# Altium project Ezlo_Voice_AssistantHUB.PrjPcb (part 8 of 10)

## Sheet USB_Sheet.SchDoc
size A4; DocumentNumber: 19; SheetNumber: 19; SheetTotal: 27
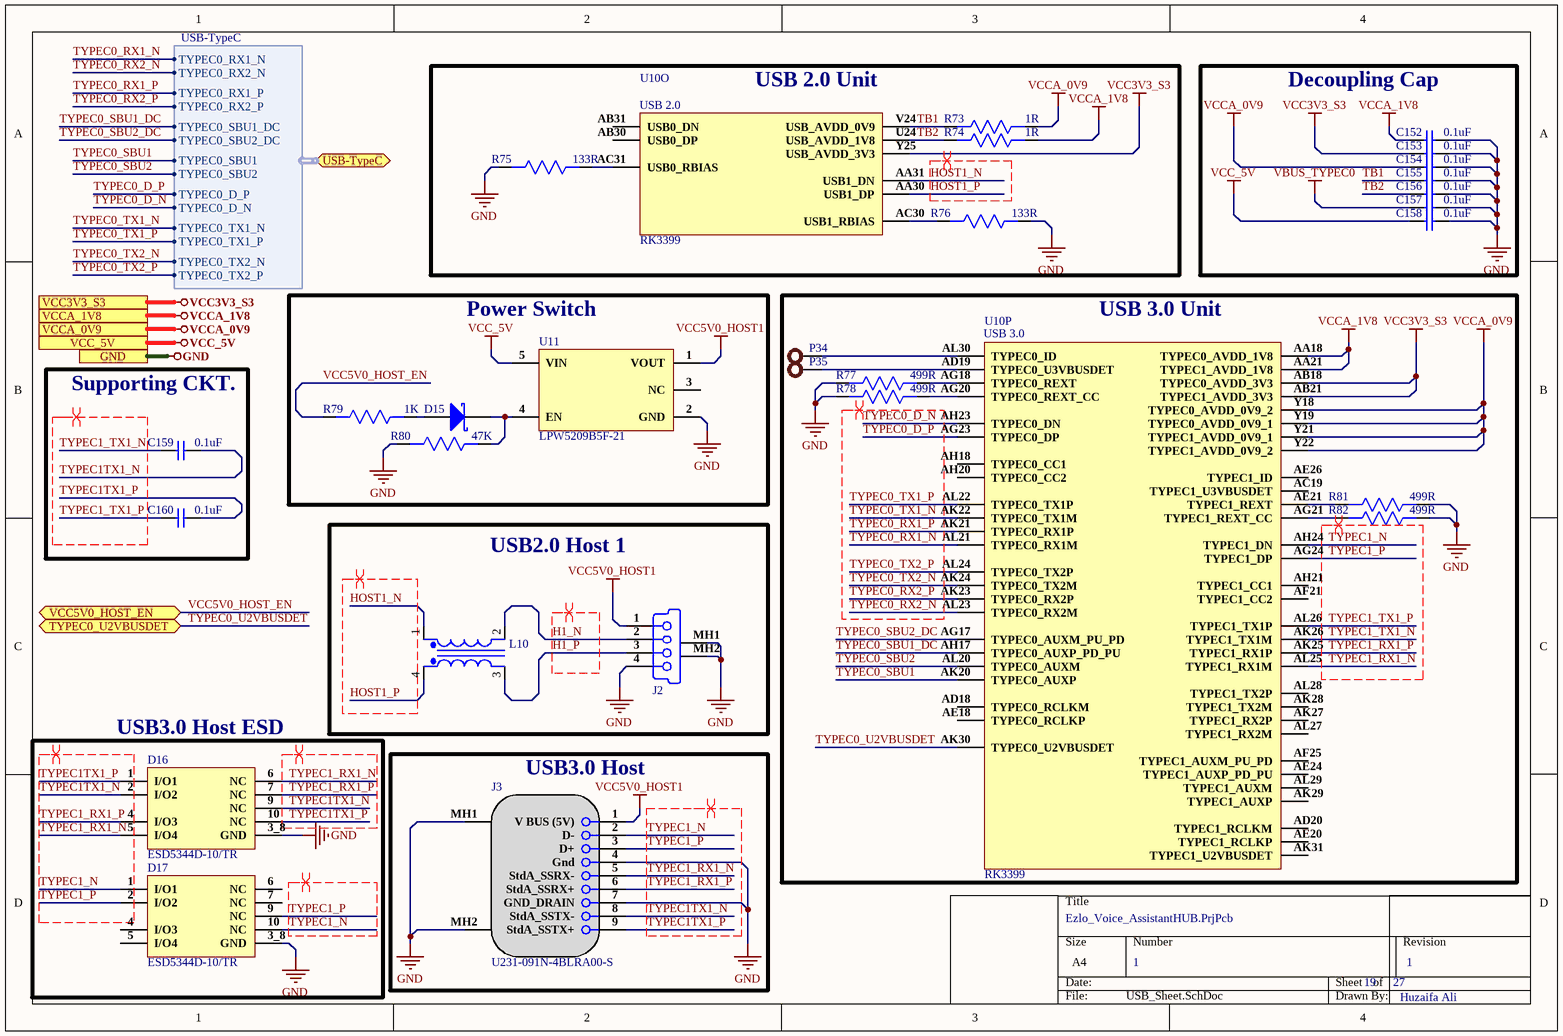
[diagram p17: USB_Sheet.SchDoc]

### Parts
C152  0.1uF  [Cap0402]
C153  0.1uF  [Cap0402]
C154  0.1uF  [Cap0402]
C155  0.1uF  [Cap0402]
C156  0.1uF  [Cap0402]
C157  0.1uF  [Cap0402]
C158  0.1uF  [Cap0402]
C159  0.1uF  [Cap0402]
C160  0.1uF  [Cap0402]
D15  B5819WS  [SOD-323]  (value not drawn)
D16  ESD5344D-10/TR  [DFN2510-10L]
D17  ESD5344D-10/TR  [DFN2510-10L]
J2  61400416021  [61400416021]  (value not drawn)
J3  U231-091N-4BLRA00-S  [U231-091N-4BLRA00-S]
L10  SDCW2012-2-900TF  [SDCW2012-2-900TF]  (value not drawn)
P34  TEST POINT  [TEST POINT]  (value not drawn)
P35  TEST POINT  [TEST POINT]  (value not drawn)
R73  1R  [Res0603]
R74  1R  [Res0603]
R75  133R  [Res0603]
R76  133R  [Res0603]
R77  499R  [Res0603]
R78  499R  [Res0603]
R79  1K  [Res0603]
R80  47K  [Res0603]
R81  499R  [Res0603]
R82  499R  [Res0603]
U10  RK3399  [RK3399]  (parts O,P of 34)
U11  LPW5209B5F-21  [SOT-23-5]

### Blocks framed on the sheet
USB 2.0 Unit: R73-R76 U10
Decoupling Cap: C152-C158
Power Switch: D15 R79 R80 U11
USB 3.0 Unit: P34 P35 R77 R78 R81 R82 U10
Supporting CKT.: C159 C160
USB2.0 Host 1: J2 L10
USB3.0 Host ESD: D16 D17
USB3.0 Host: J3

### Ports
GND, TYPEC0_U2VBUSDET (bidir), USB-TypeC (bidir, harness USB-TypeC), VCC3V3_S3, VCC5V0_HOST_EN (bidir), VCC_5V, VCCA_0V9, VCCA_1V8

### Harnesses
USB-TypeC: TYPEC0_RX1_N, TYPEC0_RX2_N, TYPEC0_RX1_P, TYPEC0_RX2_P, TYPEC0_D_P, TYPEC0_D_N, TYPEC0_TX1_N, TYPEC0_TX1_P, TYPEC0_TX2_N, TYPEC0_TX2_P, TYPEC0_SBU1, TYPEC0_SBU2, TYPEC0_SBU1_DC, TYPEC0_SBU2_DC

### Nets
GND: C152.2 C153.2 C154.2 C155.2 C156.2 C157.2 C158.2 D16.3_8(GND) D17.3_8(GND) J2.4(NC) J2.MH1 J2.MH2 J3.4(Gnd) J3.7(GND_DRAIN) J3.MH1(Tab) J3.MH2(Tab) R75.2 R76.1 R77.2 R78.2 R80.2 R81.1 R82.1 U11.2(GND) ; port GND
VBUS_TYPEC0: C157.1
VCC3V3_S3: C153.1 U10.AB18(TYPEC0_AVDD_3V3) U10.AB21(TYPEC1_AVDD_3V3) U10.Y25(USB_AVDD_3V3) ; port VCC3V3_S3
VCC5V0_HOST1: J2.1(V_BUS_(5V)) J3.1(V_BUS_(5V)) U11.1(VOUT)
VCC_5V: C158.1 U11.5(VIN) ; port VCC_5V
VCCA_0V9: C154.1 R73.1 U10.Y18(TYPEC0_AVDD_0V9_2) U10.Y19(TYPEC0_AVDD_0V9_1) U10.Y21(TYPEC1_AVDD_0V9_1) U10.Y22(TYPEC1_AVDD_0V9_2) ; port VCCA_0V9
VCCA_1V8: C152.1 R74.1 U10.AA18(TYPEC0_AVDD_1V8) U10.AA21(TYPEC1_AVDD_1V8) ; port VCCA_1V8
H1_N: J2.2(D-) L10.2
H1_P: J2.3(D+) L10.3
HOST1_N: L10.1 U10.AA31(USB1_DN)
HOST1_P: L10.4 U10.AA30(USB1_DP)
TB1: C155.1 R73.2 U10.V24(USB_AVDD_0V9)
TB2: C156.1 R74.2 U10.U24(USB_AVDD_1V8)
TYPEC0_D_N: U10.AH23(TYPEC0_DN) ; port USB-TypeC.TYPEC0_D_N
TYPEC0_D_P: U10.AG23(TYPEC0_DP) ; port USB-TypeC.TYPEC0_D_P
TYPEC0_RX1_N: U10.AL21(TYPEC0_RX1M) ; port USB-TypeC.TYPEC0_RX1_N
TYPEC0_RX1_P: U10.AK21(TYPEC0_RX1P) ; port USB-TypeC.TYPEC0_RX1_P
TYPEC0_RX2_N: U10.AL23(TYPEC0_RX2M) ; port USB-TypeC.TYPEC0_RX2_N
TYPEC0_RX2_P: U10.AK23(TYPEC0_RX2P) ; port USB-TypeC.TYPEC0_RX2_P
TYPEC0_SBU1: U10.AK20(TYPEC0_AUXP) ; port USB-TypeC.TYPEC0_SBU1
TYPEC0_SBU1_DC: U10.AH17(TYPEC0_AUXP_PD_PU) ; port USB-TypeC.TYPEC0_SBU1_DC
TYPEC0_SBU2: U10.AL20(TYPEC0_AUXM) ; port USB-TypeC.TYPEC0_SBU2
TYPEC0_SBU2_DC: U10.AG17(TYPEC0_AUXM_PU_PD) ; port USB-TypeC.TYPEC0_SBU2_DC
TYPEC0_TX1_N: U10.AK22(TYPEC0_TX1M) ; port USB-TypeC.TYPEC0_TX1_N
TYPEC0_TX1_P: U10.AL22(TYPEC0_TX1P) ; port USB-TypeC.TYPEC0_TX1_P
TYPEC0_TX2_N: U10.AK24(TYPEC0_TX2M) ; port USB-TypeC.TYPEC0_TX2_N
TYPEC0_TX2_P: U10.AL24(TYPEC0_TX2P) ; port USB-TypeC.TYPEC0_TX2_P
TYPEC0_U2VBUSDET: U10.AK30(TYPEC0_U2VBUSDET) ; port TYPEC0_U2VBUSDET
TYPEC1_N: D17.1(I/O1) D17.10(NC) J3.2(D-) U10.AH24(TYPEC1_DN)
TYPEC1_P: D17.2(I/O2) D17.9(NC) J3.3(D+) U10.AG24(TYPEC1_DP)
TYPEC1_RX1_N: D16.5(I/O4) D16.6(NC) J3.5(StdA_SSRX-) U10.AL25(TYPEC1_RX1M)
TYPEC1_RX1_P: D16.4(I/O3) D16.7(NC) J3.6(StdA_SSRX+) U10.AK25(TYPEC1_RX1P)
TYPEC1_TX1_N: C159.1 U10.AK26(TYPEC1_TX1M)
TYPEC1_TX1_P: C160.1 U10.AL26(TYPEC1_TX1P)
TYPEC1TX1_N: C159.2 D16.2(I/O2) D16.9(NC) J3.8(StdA_SSTX-)
TYPEC1TX1_P: C160.2 D16.1(I/O1) D16.10(NC) J3.9(StdA_SSTX+)
VCC5V0_HOST_EN: R79.2 ; port VCC5V0_HOST_EN
NetD15_1: D15.1(K) R80.1 U11.4(EN)
NetD15_2: D15.2(A) R79.1
NetP34_1: P34.1 U10.AL30(TYPEC0_ID)
NetP35_1: P35.1 U10.AD19(TYPEC0_U3VBUSDET)
NetR75_1: R75.1 U10.AC31(USB0_RBIAS)
NetR76_2: R76.2 U10.AC30(USB1_RBIAS)
NetR77_1: R77.1 U10.AG18(TYPEC0_REXT)
NetR78_1: R78.1 U10.AG20(TYPEC0_REXT_CC)
NetR81_2: R81.2 U10.AE21(TYPEC1_REXT)
NetR82_2: R82.2 U10.AG21(TYPEC1_REXT_CC)

Not connected (* = marked no-connect by the designer): D17 4(I/O3) 5(I/O4) 6(NC) 7(NC); U10 AB30(USB0_DP) AB31(USB0_DN) AC19(TYPEC1_U3VBUSDET) AD18(TYPEC0_RCLKM) AD20(TYPEC1_RCLKM) AE18(TYPEC0_RCLKP) AE20(TYPEC1_RCLKP) AE24(TYPEC1_AUXP_PD_PU) AE26(TYPEC1_ID) AF21(TYPEC1_CC2) AF25(TYPEC1_AUXM_PU_PD) AH18(TYPEC0_CC1) AH20(TYPEC0_CC2) AH21(TYPEC1_CC1) AK27(TYPEC1_RX2P) AK28(TYPEC1_TX2M) AK29(TYPEC1_AUXP) AK31(TYPEC1_U2VBUSDET) AL27(TYPEC1_RX2M) AL28(TYPEC1_TX2P) AL29(TYPEC1_AUXM); U11 3(NC)

### Layout directives
differential pair; differential pair class TYPEC1_IO_Lines; net class TYPEC1; rule Impedance Constraint [Min = 85.00    Max = 90.00    ]; rule Matched Net Lengths [Tolerance = 50mil]: TYPEC1_N, TYPEC1_P, TYPEC1_RX1_N, TYPEC1_RX1_P, TYPEC1_TX1_N, TYPEC1_TX1_P, TYPEC1TX1_N, TYPEC1TX1_P
differential pair; differential pair class HOST1_IO_Lines; net class HOST1; rule Matched Net Lengths [Tolerance = 50mil]; rule Impedance Constraint [Min = 85.00    Max = 90.00    ]: HOST1_N, HOST1_P
differential pair; differential pair class H1_Lines; net class H1; rule Impedance Constraint [Min = 85.00    Max = 90.00    ]; rule Matched Net Lengths [Tolerance = 50mil]: H1_N, H1_P
differential pair; differential pair class TYPEC0_IO_Lines; net class TYPEC0; rule Impedance Constraint [Min = 85.00    Max = 90.00    ]; rule Matched Net Lengths [Tolerance = 50mil]: TYPEC0_D_N, TYPEC0_D_P, TYPEC0_RX1_N, TYPEC0_RX1_P, TYPEC0_RX2_N, TYPEC0_RX2_P, TYPEC0_TX1_N, TYPEC0_TX1_P, TYPEC0_TX2_N, TYPEC0_TX2_P

### Notes on the sheet
- 1
- Huzaifa Ali
- (in symbol RK3399, part O) USB 2.0
- (in symbol RK3399, part P) USB 3.0

### Library data of the parts
C152-C160 = CC0402KRX5R6BB104: CAP CER 0.1UF 10V X5R 0402; Manufacturer: Yageo; Capacitance: 100nF; Tolerance: 10%; Dissipation Factor: 5%; Insulation Resistance: 10GR; Supplier 1: Digi-Key; Manufacturer Part Number: CC0402KRX5R6BB104; RoHS: Yes; Category: Ceramic Capacitors; Stock 1: 6385580; Pricing 1: 1=0.10000, 10=0.02700, 50=0.01500, 100=0.01220, 500=0.00874, 1000=0.00687, 2500=0.00625, 5000=0.00575 (USD); Mount: Surface Mount; Case/Package: 0402; Number of Pins: 2; Case Code (Imperial): 0402; Case Code (Metric): 1005; Min Operating Temperature: -55°C; Max Operating Temperature: 85°C; Dielectric: X5R; Packaging: Tape and Reel; Voltage Rating: 10V; Package Quantity: 1; Termination: SMD/SMT; Voltage Rating (DC): 10V; Series: CC; Length: 1mm; Width: 0.02inch; Height: 0.5mm; Depth: 0.5mm; Thickness: 0.022inch; Radiation Hardening: No; RoHS Compliant: Yes; REACH SVHC: No SVHC; Lead Free: Lead Free; Halogen Free: Halogen Free; ComponentLink1URL: https://datasheet.ciiva.com/144/mlccorderingcode-144029.pdf?src-supplier=Digi-Key; ComponentLink1Description: https://datasheet.ciiva.com/144/mlccorderingcode-144029.pdf?src-supplier=Digi-Key; ComponentLink2URL: https://datasheet.ciiva.com/144/mlccorderingcode-144028.pdf?src-supplier=Digi-Key; ComponentLink2Description: https://datasheet.ciiva.com/144/mlccorderingcode-144028.pdf?src-supplier=Digi-Key; ComponentLink3URL: https://datasheet.ciiva.com/144/mlccorderingcode-144030.pdf?src-supplier=Digi-Key; ComponentLink3Description: https://datasheet.ciiva.com/144/mlccorderingcode-144030.pdf?src-supplier=Digi-Key; ComponentLink4URL: https://datasheet.ciiva.com/7978/1359354-7978091.pdf?src-supplier=Element14; ComponentLink4Description: https://datasheet.ciiva.com/7978/1359354-7978091.pdf?src-supplier=Element14; ComponentLink5URL: https://datasheet.ciiva.com/11587/upy-gphc-x5r-4v-to-50v-12-11587302.pdf?src-supplier=Avnet; ComponentLink5Description: https://datasheet.ciiva.com/11587/upy-gphc-x5r-4v-to-50v-12-11587302.pdf?src-supplier=Avnet; Supplier Part Number 1: 311-1336-1-ND
D15 = B5819WS: DIODE SCHOTTKY 40V 1A SOD323; Manufacturer: MDD; Manufacturer Part Number: B5819WS-TP; Max Surge Current: 10A; Forward Voltage: 900mV; Max Reverse Leakage Current: 1mA; Element Configuration: Single; Supplier 1: Arrow Electronics; RoHS: Yes; Category: Rectifier Diodes; Stock 1: 1701; Pricing 1: 1=0.34370, 10=0.18990, 25=0.18810, 100=0.11820, 250=0.11700, 500=0.08890, 1000=0.07420 (USD); Mount: Surface Mount; Number of Pins: 2; Min Operating Temperature: -65°C; Max Operating Temperature: 125°C; Package Quantity: 1; Packaging: Tape and Reel; Average Rectified Current: 1A; Peak Non-Repetitive Surge Current: 10A; Max Reverse Voltage (DC): 40V; Series: -; Radiation Hardening: No; RoHS Compliant: Yes; Lead Free: Lead Free; Supplier Part Number 1: B5819WS-TP; ComponentLink1Description: LCSC; ComponentLink1URL: https://lcsc.com/product-detail/Schottky-Barrier-Diodes-SBD_MDD-Microdiode-Electronics-B5819WS_C64886.html
D16 D17 = ESD5344D-10/TR: DFN2510-10L ESD Protection Devices ROHS; Manufacturer: WILLSEMI; ComponentLink1Description: LCSC; ComponentLink1URL: https://www.lcsc.com/product-detail/span-style-background-color-ff0-ESD-span-Protection-Devices_WILLSEMI-Will-Semicon-ESD5344D-10-TR_C239666.html; Manufacturer Part Number: ESD5344D-10/TR
J2 = 61400416021: CONN RCPT USB2.0 TYPEA 4POS R/A; Manufacturer: Wurth Electronics; Gender: Receptacle; Connector Type: USB; Number of Contacts: 4; Current Rating: 1A; Voltage Rating: 30V; Number of Ports: 1; Insulation Resistance: 1GR; Supplier 1: Digi-Key; Manufacturer Part Number: 61400416021; Stock 1: 7748; Pricing 1: 1=0.99, 10=0.874, 50=0.823, 100=0.739, 250=0.672 (USD); Mount: Through Hole,Horizontal; Contact Plating: Gold; Contact Material: Copper Alloy; Color: White; Min Operating Temperature: -40°C; Max Operating Temperature: 105°C; Packaging: Tray; Package Quantity: 60; Series: WR-COM; Number of Positions: 4; Termination: Solder; Orientation: Right Angle; USB Standard: USB 2.0; Length: 15.8mm; Width: 14.4mm; REACH SVHC: Unknown; Lead Free: Lead Free; Flammability Rating: UL94 V-0; ComponentLink1URL: https://www.distrelec.biz/Web/Downloads/he/et/4257096_eng_datasheet.pdf?mime=application%2Fpdf&src-supplier=Distrelec; ComponentLink1Description: https://www.distrelec.biz/Web/Downloads/he/et/4257096_eng_datasheet.pdf?mime=application%2Fpdf&src-supplier=Distrelec; ComponentLink2URL: http://www.farnell.com/datasheets/1712150.pdf?src-supplier=Element14; ComponentLink2Description: http://www.farnell.com/datasheets/1712150.pdf?src-supplier=Element14; ComponentLink3URL: http://www.farnell.com/datasheets/1712150.pdf?src-supplier=Newark; ComponentLink3Description: http://www.farnell.com/datasheets/1712150.pdf?src-supplier=Newark; ComponentLink4URL: http://katalog.we-online.de/kataloge/eican/media/pdf/61400416021.pdf?src-supplier=Mouser; ComponentLink4Description: http://katalog.we-online.de/kataloge/eican/media/pdf/61400416021.pdf?src-supplier=Mouser; ComponentLink5URL: https://katalog.we-online.de/em/datasheet/61400416021.pdf?src-supplier=Digi-Key; ComponentLink5Description: https://katalog.we-online.de/em/datasheet/61400416021.pdf?src-supplier=Digi-Key; ComponentLink6URL: http://documents.rs-components.com/techlib://itc_doclist_GB.htm?stockno=7480863&src-supplier=RSComponents; ComponentLink6Description: http://documents.rs-components.com/techlib://itc_doclist_GB.htm?stockno=7480863&src-supplier=RSComponents; ComponentLink7URL: http://www.produktinfo.conrad.com/datenblaetter/1000000-1099999/001088207-da-01-en-WR_COM_USB_TYP_A__61400416021.pdf?src-supplier=Conrad; ComponentLink7Description: http://www.produktinfo.conrad.com/datenblaetter/1000000-1099999/001088207-da-01-en-WR_COM_USB_TYP_A__61400416021.pdf?src-supplier=Conrad; Supplier Part Number 1: 732-2106-ND
J3 = U231-091N-4BLRA00-S: USB 3.0 1.8A 1 260℃ Surface Mount 9 Female -40℃~+85℃ Gold Copper Alloy Type-A SMD USB Connectors ROHS; Manufacturer: XKB Connectivity; Manufacturer Part Number: U231-091N-4BLRA00-S; Footprint: Custom; ComponentLink1Description: LCSC; ComponentLink1URL: https://lcsc.com/product-detail/USB-Connectors_XKB-Connectivity-U231-091N-4BLRA00-S_C2880618.html
L10 = SDCW2012-2-900TF: 90Ω@100MHz -40℃~+85℃ 350mΩ 50V 2 330mA 125V 0805 Common Mode Filters ROHS; Manufacturer: Sunlord; Supplier 1: Digi-Key; Manufacturer Part Number: SDCW2012-2-900TF; RoHS: No; Category: Common Mode Chokes; Supplier Part Number 1: 3442-SDCW2012-2-900TFCT-ND; ComponentLink1Description: LCSC; ComponentLink1URL: https://www.lcsc.com/product-detail/Common-Mode-Filters_Sunlord-SDCW2012-2-900TF_C54888.html
P34 P35 = TEST POINT: Test Point ON
R73 R74 = 0603WAF100KT5E: 1Ω 0603 100mW; Manufacturer: UNI-ROYAL; ComponentLink1Description: LCSC; ComponentLink1URL: https://lcsc.com/product-detail/Chip-span-style-background-color-ff0-Resistor-span-Surface-Mount_UNI-ROYAL-Uniroyal-Elec-0603WAF100KT5E_C22936.html; Manufacturer Part Number: 0603WAF100KT5E; Footprint: 0603
R75 R76 = 0603WAF1330T5E: 133Ω 0603 Chip Resistor - Surface Mount ROHS; Manufacturer: UNI-ROYAL; ComponentLink1Description: LCSC; ComponentLink1URL: https://lcsc.com/product-detail/Chip-span-style-background-color-ff0-Resistor-span-Surface-Mount_UNI-ROYAL-Uniroyal-Elec-0603WAF1330T5E_C22871.html; Manufacturer Part Number: 0603WAF1330T5E; Footprint: 0603
R77 R78 R81 R82 = ERA3AEB4990V: RES SMD 499 OHM 0.1% 1/10W 0603; Manufacturer: Panasonic; Manufacturer Part Number: ERA-3AEB4990V; Power Rating: 100mW; Voltage Rating: 150V; Temperature Coefficient: 25ppm/°C; Voltage Rating (DC): 75V; Supplier 1: Arrow Electronics; RoHS: Yes; Category: Chip SMD Resistors; Stock 1: 4562; Pricing 1: 1=0.31590, 10=0.28840, 25=0.27580, 100=0.11110, 250=0.10990, 500=0.08340, 1000=0.04530, 3000=0.04480 (USD); Mount: Surface Mount; Case/Package: 0603; Number of Pins: 2; Case Code (Metric): 1608; Case Code (Imperial): 0603; Contact Plating: Tin; Min Operating Temperature: -55°C; Max Operating Temperature: 155°C; Resistance: 499R; Tolerance: 0.1%; Packaging: Tape and Reel; Package Quantity: 1; Resistor Type: Thin Film,Metal Film; Number of Terminations: 2; Termination: SMD/SMT; Max Power Dissipation: 100mW; Features: Automotive AEC-Q200; Series: ERA-3A; Resistance Tolerance: 0.1%; Construction: Rectangular; Technology: METAL FILM; Length: 1.6mm; Width: 0.8mm; Height: 0.45mm; Depth: 0.8mm; Radiation Hardening: No; REACH SVHC: No SVHC; Military Standard: Not; Lead Free: Lead Free; RoHS Compliant: Yes; ComponentLink1URL: https://datasheet.ciiva.com/11810/0900766b80eb1d8c-11810911.pdf?src-supplier=RSComponents; ComponentLink1Description: https://datasheet.ciiva.com/11810/0900766b80eb1d8c-11810911.pdf?src-supplier=RSComponents; ComponentLink2URL: https://datasheet.ciiva.com/29183/451973-da-01-en-widerstand-0603-era-29183924.pdf?src-supplier=Conrad; ComponentLink2Description: https://datasheet.ciiva.com/29183/451973-da-01-en-widerstand-0603-era-29183924.pdf?src-supplier=Conrad; ComponentLink3URL: https://datasheet.ciiva.com/6201/485442-6201036.pdf?src-supplier=Farnell; ComponentLink3Description: https://datasheet.ciiva.com/6201/485442-6201036.pdf?src-supplier=Farnell; ComponentLink4URL: https://datasheet.ciiva.com/7920/485442-7920378.pdf?src-supplier=Element14; ComponentLink4Description: https://datasheet.ciiva.com/7920/485442-7920378.pdf?src-supplier=Element14; ComponentLink5URL: https://datasheet.ciiva.com/7920/485442-7920379.pdf?src-supplier=Element14; ComponentLink5Description: https://datasheet.ciiva.com/7920/485442-7920379.pdf?src-supplier=Element14; ComponentLink6URL: https://datasheet.ciiva.com/9181/aoa0000ce26-9181477.pdf?src-supplier=Avnet; ComponentLink6Description: https://datasheet.ciiva.com/9181/aoa0000ce26-9181477.pdf?src-supplier=Avnet; ComponentLink7URL: https://datasheet.ciiva.com/30161/54aoa0000ce26-30161593.pdf?src-supplier=Onlinecomponents.com; ComponentLink7Description: https://datasheet.ciiva.com/30161/54aoa0000ce26-30161593.pdf?src-supplier=Onlinecomponents.com; Supplier Part Number 1: ERA-3AEB4990V
R79 = RT0603DRD071KL: RES SMD 1K OHM 0.5% 1/10W 0603; Manufacturer: Yageo; Resistance: 1kR; Temperature Coefficient: 25ppm/°C; Power Rating: 100mW; Voltage Rating: 75V; Voltage Rating (DC): 50V; Supplier 1: Digi-Key; Manufacturer Part Number: RT0603DRD071KL; Stock 1: 178947; Pricing 1: 1=0.2, 10=0.167, 100=0.0651, 1000=0.02725, 2500=0.02498 (USD); Case/Package: 0603; Contact Plating: Tin,Matte; Case Code (Metric): 1608; Case Code (Imperial): 0603; Min Operating Temperature: -55°C; Max Operating Temperature: 125°C; Tolerance: 0.5%; Composition: Thin Film; Packaging: Tape and Reel; Termination: SMD/SMT; Radiation Hardening: No; Lead Free: Lead Free; ComponentLink1URL: http://www.mouser.com/ds/2/447/yageodocoutput-1125656.pdf?src-supplier=Mouser; ComponentLink1Description: http://www.mouser.com/ds/2/447/yageodocoutput-1125656.pdf?src-supplier=Mouser; ComponentLink2URL: http://www.yageo.com/documents/recent/PYu-RT_1-to-0.05_RoHS_L_6.pdf?src-supplier=Avnet; ComponentLink2Description: http://www.yageo.com/documents/recent/PYu-RT_1-to-0.05_RoHS_L_6.pdf?src-supplier=Avnet; Supplier Part Number 1: 311-1.0KDDKR-ND
R80 = RC0603JR-0747KL: Res Thick Film 0603 30K Ohm 1% 0.1W(1/10W) ±100ppm/C Epoxy Pad SMD T/R; Manufacturer: Yageo; Resistance: 47kR; Tolerance: 5%; Power Rating: 100mW; Voltage Rating (DC): 50V; Temperature Coefficient: 100ppm/°C; Supplier 1: Arrow; Manufacturer Part Number: RC0603JR-0747KL; Stock 1: 599135; Pricing 1: 5000=0.0025, 10000=0.0022, 25000=0.0019, 1=0.0011, 6000=0.001 (USD); Case/Package: 0603; Number of Pins: 2; Case Code (Imperial): 0603; Case Code (Metric): 1608; Min Operating Temperature: -55°C; Max Operating Temperature: 155°C; Packaging: Tape and Reel; Voltage Rating: 50V; Package Quantity: 5000; Termination: SMD/SMT; Military Standard: Not; Composition: Thick Film; Length: 1.6mm; Height: 0.45mm; Width: 0.8mm; Depth: 0.8mm; REACH SVHC: No SVHC; Lead Free: Lead Free; ComponentLink1URL: http://www.farnell.com/datasheets/443971.pdf; ComponentLink1Description: http://www.farnell.com/datasheets/443971.pdf; ComponentLink2URL: http://www.mouser.com/catalog/specsheets/RC0603.pdf; ComponentLink2Description: http://www.mouser.com/catalog/specsheets/RC0603.pdf; Supplier Part Number 1: RC0603JR-0747KL; Supplier 2: Digi-Key; RoHS: Yes; Category: Chip SMD Resistors; Stock 2: 1087850; Pricing 2: 1=0.10000, 10=0.02300, 100=0.00930, 1000=0.00417, 2500=0.00362 (USD); Size Code: 0603; Number of Terminations: 2; Resistor Type: Thick Film; Features: Moisture Resistant; Series: RC; Max Power Dissipation: 100mW; Construction: Rectangular; Resistance Tolerance: 1%; RoHS Compliant: Yes; ComponentLink3URL: https://datasheet.ciiva.com/46395/443971-46395003.pdf?src-supplier=Element14; ComponentLink3Description: https://datasheet.ciiva.com/46395/443971-46395003.pdf?src-supplier=Element14; ComponentLink4URL: https://datasheet.ciiva.com/12558/rc0603-272842-12558744.pdf?src-supplier=Mouser; ComponentLink4Description: https://datasheet.ciiva.com/12558/rc0603-272842-12558744.pdf?src-supplier=Mouser; Supplier Part Number 2: 311-30.0KHRCT-ND
U10 = RK3399: RK3399 CPU BGA for HD set-top box chip BGA Chipse; Manufacturer: Fuzhou Rockchip Electronics; ComponentLink1Description: Aliexpress; ComponentLink1URL: https://www.aliexpress.com/item/1005001971093459.html?spm=a2g0n.productlist.0.0.3c7csv8Qsv8Quh&browser_id=3ac7e9efb8074641aaabc4d871f09748&aff_trace_key=&aff_platform=msite&m_page_id=181389a08711fc2600d8cc522bab8d702dd4189be0&gclid=&pdp_npi=2%40dis%21USD%21%2123.6%21%21%21%21%21%402101d91e16545120399167831e8b89%21%21sea&algo_pvid=4303aedd-774c-4013-953d-920f10b55003; Manufacturer Part Number: RK3399; Footprint: FCBGA828
U11 = LPW5209B5F-21: 2.1Amp SOT-23-5 Power Distribution Switches ROHS; Manufacturer: LOWPOWER; Supplier 1: LCSC; Manufacturer Part Number: LPW5209B5F-21; RoHS: No; Stock 1: 3390; Pricing 1: 5=0.14760, 50=0.12140, 150=0.10820, 500=0.09840, 2500=0.09050, 5000=0.08660 (USD); Supplier Part Number 1: C517266

## Sheet MISCIO_Sheet.SchDoc
size A4; DocumentNumber: 16; SheetNumber: 16; SheetTotal: 27
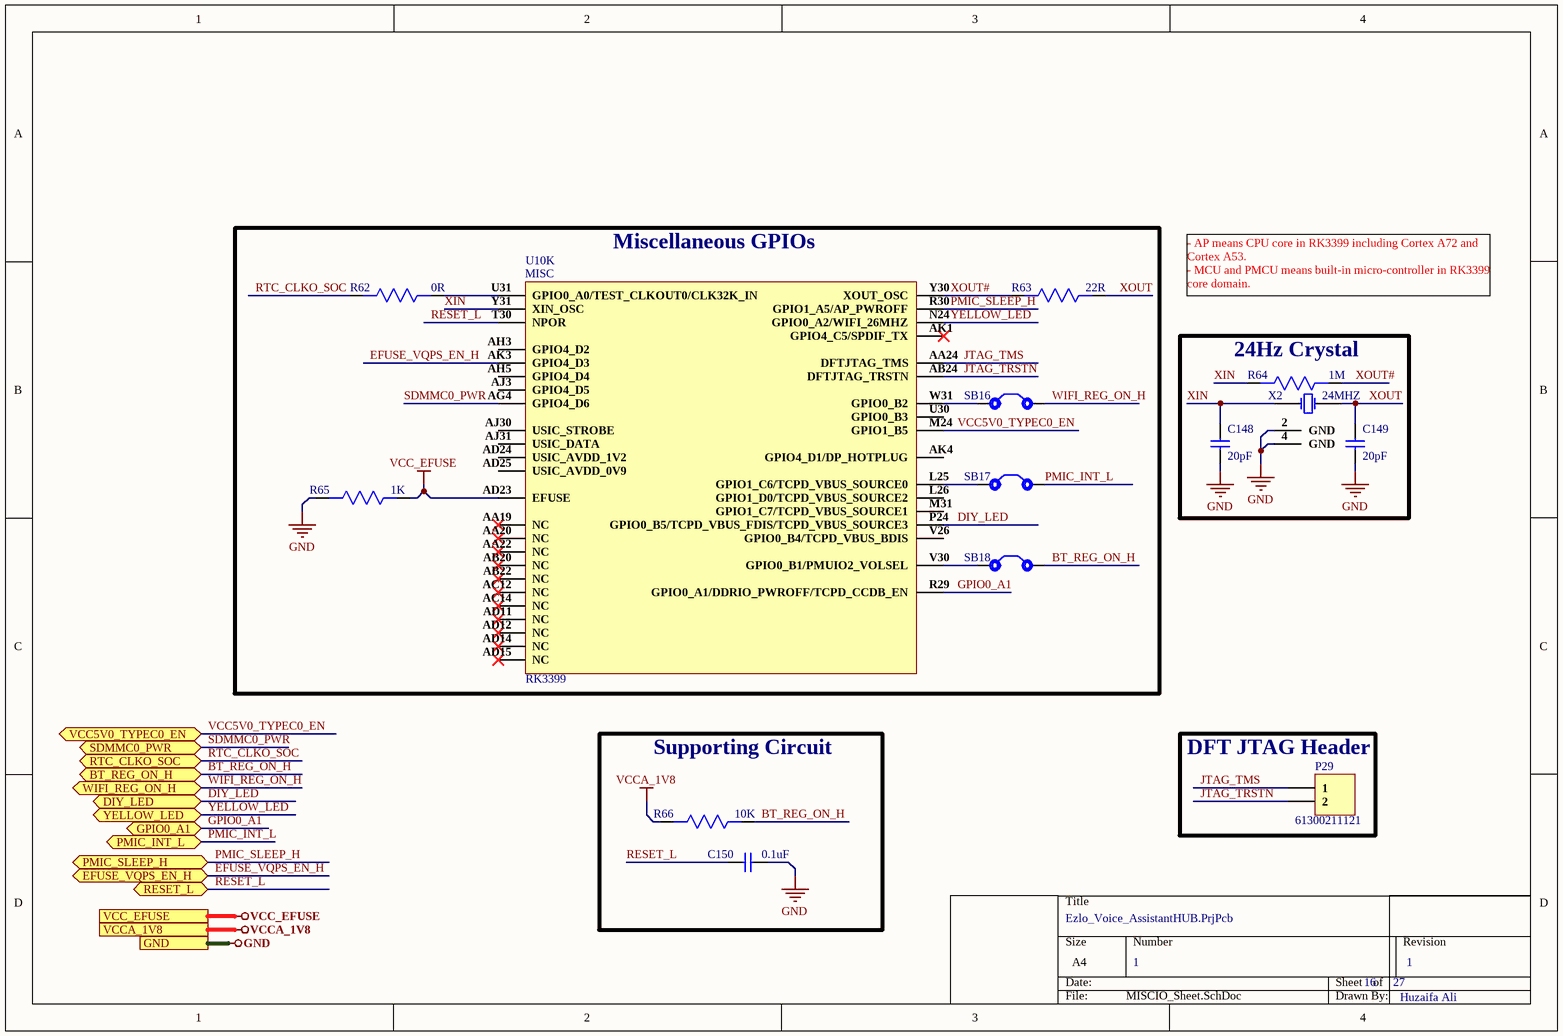
[diagram p18: MISCIO_Sheet.SchDoc]

### Parts
C148  20pF  [Cap0603]
C149  20pF  [Cap0603]
C150  0.1uF  [Cap0402]
P29  61300211121  [HDR1X2]
R62  0R  [Res0603]
R63  22R  [Res0603]
R64  1M  [Res0603]
R65  1K  [Res0603]
R66  10K  [Res0603]
SB16  Solder Bridge  [Solder Bridge]  (value not drawn)
SB17  Solder Bridge  [Solder Bridge]  (value not drawn)
SB18  Solder Bridge  [Solder Bridge]  (value not drawn)
U10  RK3399  [RK3399]  (part K of 34)
X2  24MHZ  [X322524MOB4SI]

### Blocks framed on the sheet
Miscellaneous GPIOs: R62 R63 R65 SB16-SB18 U10
24Hz Crystal: C148 C149 R64 X2
Supporting Circuit: C150 R66
DFT JTAG Header: P29

### Ports
BT_REG_ON_H (bidir), DIY_LED (bidir), EFUSE_VQPS_EN_H (bidir), GND, GPIO0_A1 (bidir), PMIC_INT_L (bidir), PMIC_SLEEP_H (bidir), RESET_L (bidir), RTC_CLKO_SOC (bidir), SDMMC0_PWR (bidir), VCC5V0_TYPEC0_EN (bidir), VCC_EFUSE, VCCA_1V8, WIFI_REG_ON_H (bidir), YELLOW_LED (bidir)

### Nets
GND: C148.1 C149.1 C150.2 R65.2 X2.2(GND) X2.4(GND) ; port GND
VCC_EFUSE: R65.1 U10.AD23(EFUSE) ; port VCC_EFUSE
VCCA_1V8: R66.2 ; port VCCA_1V8
BT_REG_ON_H: R66.1 SB18.2 ; port BT_REG_ON_H
DIY_LED: U10.P24(GPIO0_B5/TCPD_VBUS_FDIS/TCPD_VBUS_SOURCE3) ; port DIY_LED
EFUSE_VQPS_EN_H: U10.AK3(GPIO4_D3) ; port EFUSE_VQPS_EN_H
GPIO0_A1: U10.R29(GPIO0_A1/DDRIO_PWROFF/TCPD_CCDB_EN) ; port GPIO0_A1
JTAG_TMS: P29.1 U10.AA24(DFTJTAG_TMS)
JTAG_TRSTN: P29.2 U10.AB24(DFTJTAG_TRSTN)
PMIC_INT_L: SB17.2 ; port PMIC_INT_L
PMIC_SLEEP_H: U10.R30(GPIO1_A5/AP_PWROFF) ; port PMIC_SLEEP_H
RESET_L: C150.1 U10.T30(NPOR) ; port RESET_L
RTC_CLKO_SOC: R62.2 ; port RTC_CLKO_SOC
SDMMC0_PWR: U10.AG4(GPIO4_D6) ; port SDMMC0_PWR
VCC5V0_TYPEC0_EN: U10.M24(GPIO1_B5) ; port VCC5V0_TYPEC0_EN
WIFI_REG_ON_H: SB16.2 ; port WIFI_REG_ON_H
XIN: C148.2 R64.2 U10.Y31(XIN_OSC) X2.1(CRYSTAL)
XOUT: C149.2 R63.1 X2.3(CRYSTAL)
XOUT#: R63.2 R64.1 U10.Y30(XOUT_OSC)
YELLOW_LED: U10.N24(GPIO0_A2/WIFI_26MHZ) ; port YELLOW_LED
NetR62_1: R62.1 U10.U31(GPIO0_A0/TEST_CLKOUT0/CLK32K_IN)
NetSB16_1: SB16.1 U10.W31(GPIO0_B2)
NetSB17_1: SB17.1 U10.L25(GPIO1_C6/TCPD_VBUS_SOURCE0)
NetSB18_1: SB18.1 U10.V30(GPIO0_B1/PMUIO2_VOLSEL)

Not connected (* = marked no-connect by the designer): U10 AA19(NC)* AA20(NC)* AA22(NC)* AB20(NC)* AB22(NC)* AC12(NC)* AC14(NC)* AD11(NC)* AD12(NC)* AD14(NC)* AD15(NC)* AD24(USIC_AVDD_1V2) AD25(USIC_AVDD_0V9) AH3(GPIO4_D2) AH5(GPIO4_D4) AJ3(GPIO4_D5) AJ30(USIC_STROBE) AJ31(USIC_DATA) AK1(GPIO4_C5/SPDIF_TX)* AK4(GPIO4_D1/DP_HOTPLUG) L26(GPIO1_D0/TCPD_VBUS_SOURCE2) M31(GPIO1_C7/TCPD_VBUS_SOURCE1) U30(GPIO0_B3) V26(GPIO0_B4/TCPD_VBUS_BDIS)

### Notes on the sheet
- - AP means CPU core in RK3399 including Cortex A72 and Cortex A53.
  - MCU and PMCU means built-in micro-controller in RK3399 core domain.
- 1
- Huzaifa Ali
- (in symbol RK3399, part K) MISC

### Library data of the parts
C148 C149 = CC0603JRNPO9BN200: CAP CER 20PF 50V C0G/NPO 0603; Manufacturer: Yageo; Tolerance: 5%; Dielectric: C0G; Supplier 1: Digi-Key; Manufacturer Part Number: CC0603JRNPO9BN200; Stock 1: 259568; Pricing 1: 1=0.1, 10=0.048, 100=0.0214, 500=0.01526, 1000=0.01198 (USD); Mount: Surface Mount; Case/Package: 0603; Number of Pins: 2; Weight: 7.1E-05oz; Case Code (Imperial): 0603; Case Code (Metric): 1608; Min Operating Temperature: -55°C; Max Operating Temperature: 125°C; Capacitance: 20pF; Package Quantity: 4000; Voltage Rating (DC): 50V; Packaging: Tape and Reel; Voltage Rating: 50V; Termination: SMD/SMT; Composition: Ceramic; Length: 1.6mm; Width: 0.8mm; Thickness: 0.035inch; Depth: 0.8mm; REACH SVHC: Unknown; Lead Free: Lead Free; ComponentLink1URL: http://www.farnell.com/datasheets/1132289.pdf?src-supplier=Element14; ComponentLink1Description: http://www.farnell.com/datasheets/1132289.pdf?src-supplier=Element14; ComponentLink2URL: http://www.yageo.com/documents/recent/UPY-GP_NP0_16V-to-50V_16.pdf?src-supplier=Digi-Key; ComponentLink2Description: http://www.yageo.com/documents/recent/UPY-GP_NP0_16V-to-50V_16.pdf?src-supplier=Digi-Key; Supplier Part Number 1: 311-1424-6-ND
C150 = CC0402KRX5R6BB104: as C152-C160 on sheet USB_Sheet; Supplier 1: Digi-Key; Manufacturer Part Number: CC0402KRX5R6BB104; RoHS: Yes; Category: Ceramic Capacitors; Stock 1: 6385580; Pricing 1: 1=0.10000, 10=0.02700, 50=0.01500, 100=0.01220, 500=0.00874, 1000=0.00687, 2500=0.00625, 5000=0.00575 (USD); Mount: Surface Mount; Case/Package: 0402; Number of Pins: 2; Case Code (Imperial): 0402; Case Code (Metric): 1005; Min Operating Temperature: -55°C; Max Operating Temperature: 85°C; Dielectric: X5R; Packaging: Tape and Reel; Voltage Rating: 10V; Package Quantity: 1; Termination: SMD/SMT; Voltage Rating (DC): 10V; Series: CC; Length: 1mm; Width: 0.02inch; Height: 0.5mm; Depth: 0.5mm; Thickness: 0.022inch; Radiation Hardening: No; RoHS Compliant: Yes; REACH SVHC: No SVHC; Lead Free: Lead Free; Halogen Free: Halogen Free; ComponentLink1URL: https://datasheet.ciiva.com/144/mlccorderingcode-144029.pdf?src-supplier=Digi-Key; ComponentLink1Description: https://datasheet.ciiva.com/144/mlccorderingcode-144029.pdf?src-supplier=Digi-Key; ComponentLink2URL: https://datasheet.ciiva.com/144/mlccorderingcode-144028.pdf?src-supplier=Digi-Key; ComponentLink2Description: https://datasheet.ciiva.com/144/mlccorderingcode-144028.pdf?src-supplier=Digi-Key; ComponentLink3URL: https://datasheet.ciiva.com/144/mlccorderingcode-144030.pdf?src-supplier=Digi-Key; ComponentLink3Description: https://datasheet.ciiva.com/144/mlccorderingcode-144030.pdf?src-supplier=Digi-Key; ComponentLink4URL: https://datasheet.ciiva.com/7978/1359354-7978091.pdf?src-supplier=Element14; ComponentLink4Description: https://datasheet.ciiva.com/7978/1359354-7978091.pdf?src-supplier=Element14; ComponentLink5URL: https://datasheet.ciiva.com/11587/upy-gphc-x5r-4v-to-50v-12-11587302.pdf?src-supplier=Avnet; ComponentLink5Description: https://datasheet.ciiva.com/11587/upy-gphc-x5r-4v-to-50v-12-11587302.pdf?src-supplier=Avnet; Supplier Part Number 1: 311-1336-1-ND
P29 = 61300211121: CONN HEADER VERT 2POS 2.54MM; Manufacturer: Wurth Electronics; Current Rating: 3A; Voltage Rating: 250V; Number of Positions: 2; Gender: Male; Connector Type: Male Pin; Pitch: 0.1inch; Supplier 1: Digi-Key; Manufacturer Part Number: 61300211121; Stock 1: 219205; Pricing 1: 1=0.13, 10=0.106, 25=0.088, 50=0.074, 100=0.067, 1000=0.061 (USD); Mount: Through Hole; Contact Plating: Gold; Housing Material: PBT; Contact Material: Copper Alloy,Copper; Color: Black; Min Operating Temperature: -40°C; Max Operating Temperature: 125°C; Number of Rows: 1; Contact Gender: Male; Packaging: Bulk; Termination: Through Hole; Number of Contacts: 2; Contact Mating Length: 0.236inch; REACH SVHC: Unknown; Lead Free: Lead Free; ComponentLink1URL: http://www.mouser.com/ds/2/445/6130xx11121-538006.pdf?src-supplier=Mouser; ComponentLink1Description: http://www.mouser.com/ds/2/445/6130xx11121-538006.pdf?src-supplier=Mouser; Supplier Part Number 1: 732-5315-ND
R62 = RC0603FR-070RL: RES SMD 0R, 1%, 0.1W, 0603; Manufacturer: Yageo; Resistance: 0mR; Power Rating: 100mW; Voltage Rating (DC): 50V; Temperature Coefficient: 200ppm/°C; Current Rating: 1A; Working Voltage: 75V; Supplier 1: Arrow Electronics; Manufacturer Part Number: RC0603FR-070RL; RoHS: Yes; Category: Chip SMD Resistors; Stock 1: 1270000; Pricing 1: 5000=0.00320, 5000=0.00490, 50000=0.00450, 500000=0.00250, 2500000=0.00150 (USD); Case/Package: 0603; Number of Pins: 2; Contact Plating: Tin,Matte; Case Code (Metric): 1608; Case Code (Imperial): 0603; Min Operating Temperature: -55°C; Max Operating Temperature: 155°C; Resistor Type: Thick Film; Packaging: Tape and Reel; Tolerance: 1%; Package Quantity: 5000; Voltage Rating: 50V; Number of Terminations: 2; Termination: SMD/SMT; Max Power Dissipation: 100mW; Features: Moisture Resistant; Length: 1.6mm; Width: 0.031inch; Height: 0.45mm; Depth: 0.8mm; Radiation Hardening: No; REACH SVHC: No SVHC; Lead Free: Lead Free; Military Standard: Not; ComponentLink1URL: https://datasheet.ciiva.com/11808/0900766b80f96399-11808172.pdf?src-supplier=RSComponents; ComponentLink1Description: https://datasheet.ciiva.com/11808/0900766b80f96399-11808172.pdf?src-supplier=RSComponents; ComponentLink2URL: https://datasheet.ciiva.com/5558/rc0603-272842-5558341.pdf?src-supplier=Mouser; ComponentLink2Description: https://datasheet.ciiva.com/5558/rc0603-272842-5558341.pdf?src-supplier=Mouser; ComponentLink3URL: https://datasheet.ciiva.com/46382/443971-46382072.pdf?src-supplier=Element14; ComponentLink3Description: https://datasheet.ciiva.com/46382/443971-46382072.pdf?src-supplier=Element14; ComponentLink4URL: https://datasheet.ciiva.com/29721/pyu-r-int-thick-7-29721178.pdf?src-supplier=Digi-Key; ComponentLink4Description: https://datasheet.ciiva.com/29721/pyu-r-int-thick-7-29721178.pdf?src-supplier=Digi-Key; ComponentLink5URL: https://datasheet.ciiva.com/5684/443971-5684699.pdf?src-supplier=Farnell; ComponentLink5Description: https://datasheet.ciiva.com/5684/443971-5684699.pdf?src-supplier=Farnell; ComponentLink6URL: https://datasheet.ciiva.com/7983/443971-7983627.pdf?src-supplier=Element14; ComponentLink6Description: https://datasheet.ciiva.com/7983/443971-7983627.pdf?src-supplier=Element14; ComponentLink7URL: https://datasheet.ciiva.com/29721/pyu-rc0603-51-rohs-l-4-29721179.pdf?src-supplier=Digi-Key; ComponentLink7Description: https://datasheet.ciiva.com/29721/pyu-rc0603-51-rohs-l-4-29721179.pdf?src-supplier=Digi-Key; ComponentLink8URL: https://datasheet.ciiva.com/22643/1868787-22643388.pdf?src-supplier=Element14; ComponentLink8Description: https://datasheet.ciiva.com/22643/1868787-22643388.pdf?src-supplier=Element14; Supplier Part Number 1: RC0603FR-070RL
R63 = CRCW060322R0JNEAHP: RES SMD 22 OHM 5% 1/3W 0603; Manufacturer: Vishay Dale; Temperature Coefficient: 200ppm/°C; Power Rating: 250mW; Voltage Rating: 75V; Supplier 1: Digi-Key; Manufacturer Part Number: CRCW060322R0JNEAHP; Stock 1: 245392; Pricing 1: 1=0.15, 10=0.129, 100=0.0506, 1000=0.02119, 2500=0.01942 (USD); Mount: Surface Mount; Case/Package: 0603; Weight: 7.1E-05oz; Contact Plating: Tin; Case Code (Imperial): 0603; Case Code (Metric): 1608; Min Operating Temperature: -55°C; Max Operating Temperature: 155°C; Resistance: 22R; Tolerance: 5%; Composition: Thick Film; Packaging: Tape and Reel; Package Quantity: 5000; Military Standard: Not; Length: 1.6mm; Height: 0.45mm; Width: 0.8mm; Depth: 0.85mm; Radiation Hardening: No; Lead Free: Lead Free; ComponentLink1URL: http://www.vishay.com/docs/20043/crcwhpe3.pdf?src-supplier=Avnet+Europe; ComponentLink1Description: http://www.vishay.com/docs/20043/crcwhpe3.pdf?src-supplier=Avnet+Europe; ComponentLink2URL: http://www.mouser.com/ds/2/427/dcrcwe3-109170.pdf?src-supplier=Mouser; ComponentLink2Description: http://www.mouser.com/ds/2/427/dcrcwe3-109170.pdf?src-supplier=Mouser; Supplier Part Number 1: 541-22SACT-ND
R64 = RC0603FR-071ML: Res Thick Film 0603 1M Ohm 1% 1/10W ±100ppm/°C Molded SMD Paper T/R; Manufacturer: Yageo; Voltage Rating: 75V; Voltage Rating (DC): 50V; Resistance: 1MR; Power Rating: 100mW; Application(s): HIGH RELIABILITY; Supplier 1: Arrow Electronics; Manufacturer Part Number: RC0603FR-071ML; RoHS: Yes; Category: Chip SMD Resistors; Stock 1: 8815; Pricing 1: 1=0.04260, 10=0.01610, 25=0.01590, 100=0.00650, 500=0.00520, 1000=0.00490, 3000=0.00470, 6000=0.00320, 15000=0.00260 (USD); Case/Package: 0603; Number of Pins: 2; Case Code (Imperial): 0603; Case Code (Metric): 1608; Weight: 0.000847oz; Min Operating Temperature: -55°C; Max Operating Temperature: 155°C; Tolerance: 1%; Packaging: Cut Tape; Package Quantity: 5000; Termination: SMD/SMT; Resistor Type: Thick Film; Temperature Coefficient: 100ppm/°C; Type: General Purpose; Series: RC; Technology: THICK FILM; Length: 1.6mm; Width: 0.8mm; Height: 0.45mm; Depth: 0.8mm; RoHS Compliant: Yes; REACH SVHC: No SVHC; Military Standard: Not; Lead Free: Lead Free; ComponentLink1URL: https://datasheet.ciiva.com/11819/0900766b80f96399-11819295.pdf?src-supplier=RSComponents; ComponentLink1Description: https://datasheet.ciiva.com/11819/0900766b80f96399-11819295.pdf?src-supplier=RSComponents; ComponentLink2URL: https://datasheet.ciiva.com/7983/443971-7983614.pdf?src-supplier=Element14; ComponentLink2Description: https://datasheet.ciiva.com/7983/443971-7983614.pdf?src-supplier=Element14; ComponentLink3URL: https://datasheet.ciiva.com/12555/rc0603-272842-12555388.pdf?src-supplier=Mouser; ComponentLink3Description: https://datasheet.ciiva.com/12555/rc0603-272842-12555388.pdf?src-supplier=Mouser; Supplier Part Number 1: RC0603FR-071ML
R65 = RT0603DRD071KL: as R79 on sheet USB_Sheet; Supplier 1: Digi-Key; Manufacturer Part Number: RT0603DRD071KL; Stock 1: 178947; Pricing 1: 1=0.2, 10=0.167, 100=0.0651, 1000=0.02725, 2500=0.02498 (USD); Case/Package: 0603; Contact Plating: Tin,Matte; Case Code (Metric): 1608; Case Code (Imperial): 0603; Min Operating Temperature: -55°C; Max Operating Temperature: 125°C; Tolerance: 0.5%; Composition: Thin Film; Packaging: Tape and Reel; Termination: SMD/SMT; Radiation Hardening: No; Lead Free: Lead Free; ComponentLink1URL: http://www.mouser.com/ds/2/447/yageodocoutput-1125656.pdf?src-supplier=Mouser; ComponentLink1Description: http://www.mouser.com/ds/2/447/yageodocoutput-1125656.pdf?src-supplier=Mouser; ComponentLink2URL: http://www.yageo.com/documents/recent/PYu-RT_1-to-0.05_RoHS_L_6.pdf?src-supplier=Avnet; ComponentLink2Description: http://www.yageo.com/documents/recent/PYu-RT_1-to-0.05_RoHS_L_6.pdf?src-supplier=Avnet; Supplier Part Number 1: 311-1.0KDDKR-ND
R66 = AC0603JR-0710KL: RES SMD 10K OHM 5% 1/10W 0603; Manufacturer: Yageo; Voltage Rating: 50V; Resistance: 10kR; Power Rating: 100mW; Temperature Coefficient: 100ppm/°C; Supplier 1: Future Electronics; Manufacturer Part Number: AC0603JR-0710KL; RoHS: Yes; Category: Chip SMD Resistors; Stock 1: 1533000; Pricing 1: 5000=0.00540 (USD); Case/Package: 0603; Case Code (Imperial): 0603; Case Code (Metric): 1608; Size Code: 0603; Min Operating Temperature: -55°C; Max Operating Temperature: 155°C; Packaging: Tape and Reel; Tolerance: 5%; Package Quantity: 1; Resistor Type: Thick Film; Termination: SMD/SMT; Number of Terminations: 2; Max Power Dissipation: 100mW; Features: Moisture Resistant,Automotive AEC-Q200,Anti-Sulfur; Series: AC; Construction: Rectangular; Length: 0.063inch; Width: 0.031inch; Height: 0.022inch; Depth: 0.8mm; Military Standard: Not; Lead Free: Lead Free; RoHS Compliant: Yes; ComponentLink1URL: https://datasheet.ciiva.com/5562/pyu-ac-51-rohs-l-2-5562553.pdf?src-supplier=Mouser; ComponentLink1Description: https://datasheet.ciiva.com/5562/pyu-ac-51-rohs-l-2-5562553.pdf?src-supplier=Mouser; Supplier Part Number 1: 1029044
SB16-SB18 = Solder Bridge: Solder Bridge ON
U10 = RK3399: as U10 on sheet USB_Sheet; ComponentLink1Description: Aliexpress; ComponentLink1URL: https://www.aliexpress.com/item/1005001971093459.html?spm=a2g0n.productlist.0.0.3c7csv8Qsv8Quh&browser_id=3ac7e9efb8074641aaabc4d871f09748&aff_trace_key=&aff_platform=msite&m_page_id=181389a08711fc2600d8cc522bab8d702dd4189be0&gclid=&pdp_npi=2%40dis%21USD%21%2123.6%21%21%21%21%21%402101d91e16545120399167831e8b89%21%21sea&algo_pvid=4303aedd-774c-4013-953d-920f10b55003; Manufacturer Part Number: RK3399; Footprint: FCBGA828
X2 = X322524MOB4SI: 24MHz SMD Crystal Resonator 12pF ±10ppm ±30ppm -40℃~+85℃ SMD3225-4P Crystals ROHS; Manufacturer: Yangxing Tech; ComponentLink1Description: LCSC; ComponentLink1URL: https://www.lcsc.com/product-detail/Crystals_Yangxing-Tech-X322524MOB4SI_C70590.html; Manufacturer Part Number: X322524MOB4SI; Footprint: Custom

## Sheet Interface_Sheet.SchDoc
size A4; DocumentNumber: 14; SheetNumber: 14; SheetTotal: 27
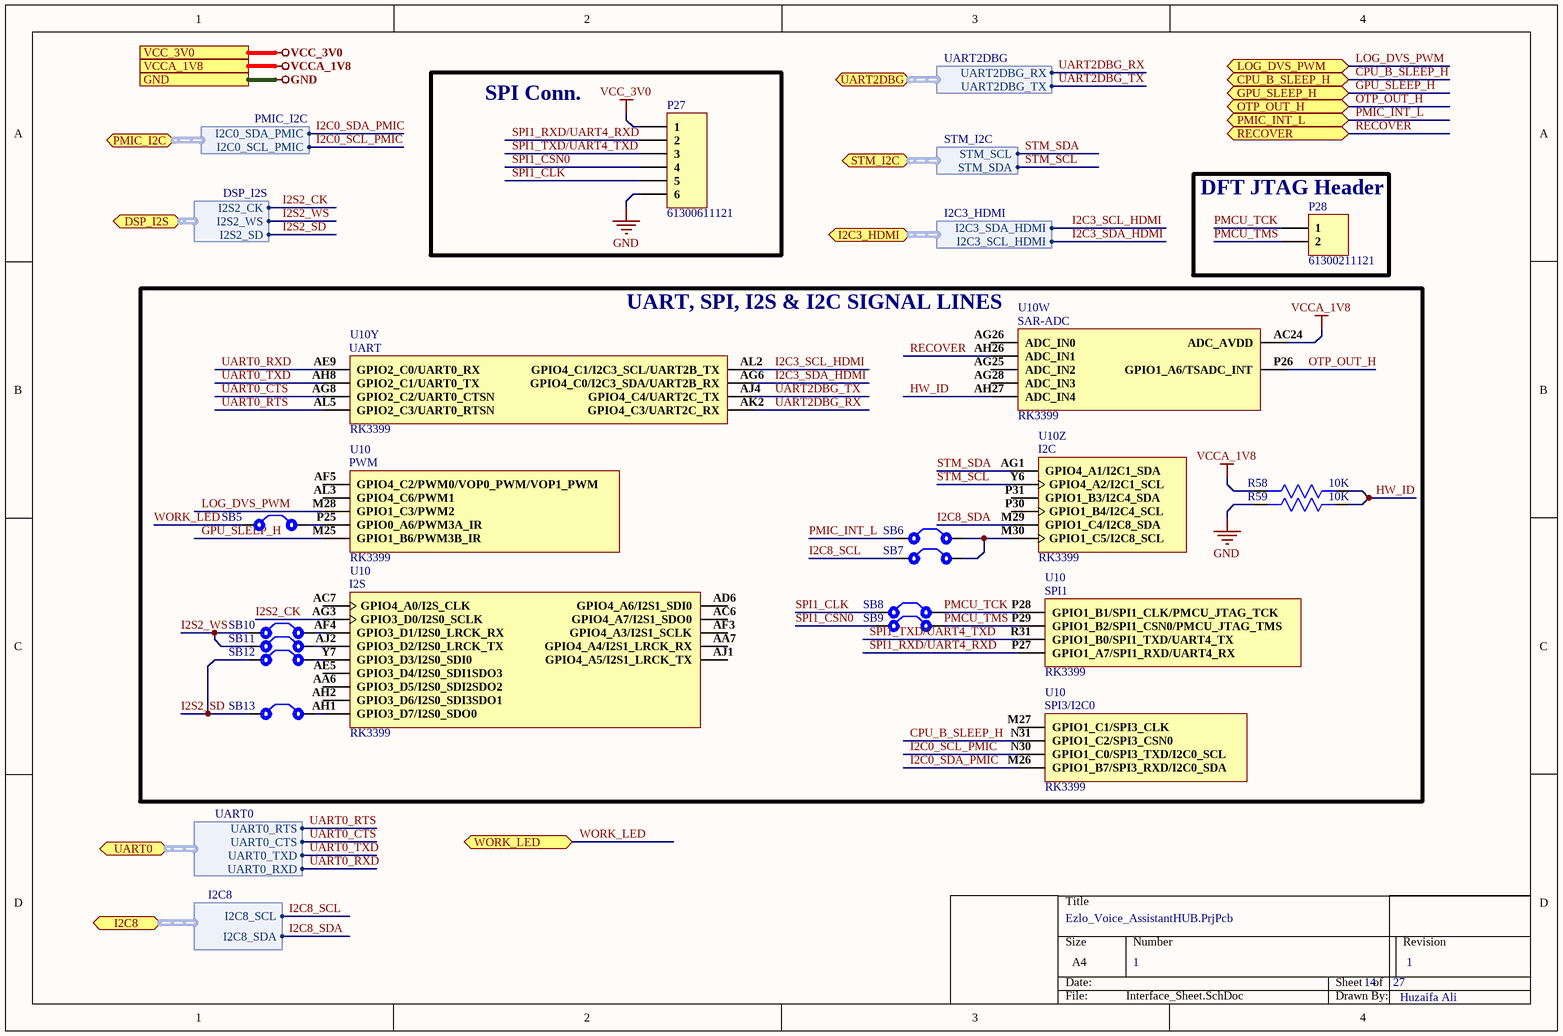
[diagram p19: Interface_Sheet.SchDoc]

### Parts
P27  61300611121  [HDR1X6]
P28  61300211121  [HDR1X2]
R58  10K  [Res0603]
R59  10K  [Res0603]
SB5  Solder Bridge  [Solder Bridge]  (value not drawn)
SB6  Solder Bridge  [Solder Bridge]  (value not drawn)
SB7  Solder Bridge  [Solder Bridge]  (value not drawn)
SB8  Solder Bridge  [Solder Bridge]  (value not drawn)
SB9  Solder Bridge  [Solder Bridge]  (value not drawn)
SB10  Solder Bridge  [Solder Bridge]  (value not drawn)
SB11  Solder Bridge  [Solder Bridge]  (value not drawn)
SB12  Solder Bridge  [Solder Bridge]  (value not drawn)
SB13  Solder Bridge  [Solder Bridge]  (value not drawn)
U10  RK3399  [RK3399]  (parts W,Y,Z,27,30,31,32 of 34)

### Blocks framed on the sheet
SPI Conn.: P27
DFT JTAG Header: P28
UART, SPI, I2S & I2C SIGNAL LINES: R58 R59 SB5-SB13 U10

### Ports
CPU_B_SLEEP_H (bidir), DSP_I2S (bidir, harness DSP_I2S), GND, GPU_SLEEP_H (bidir), I2C3_HDMI (bidir, harness I2C3_HDMI), I2C8 (bidir, harness I2C8), LOG_DVS_PWM (bidir), OTP_OUT_H (bidir), PMIC_I2C (bidir, harness PMIC_I2C), PMIC_INT_L (bidir), RECOVER (bidir), STM_I2C (bidir, harness STM_I2C), UART0 (bidir, harness UART0), UART2DBG (bidir, harness UART2DBG), VCC_3V0, VCCA_1V8, WORK_LED (bidir)

### Harnesses
PMIC_I2C: I2C0_SDA_PMIC, I2C0_SCL_PMIC
DSP_I2S: I2S2_CK, I2S2_WS, I2S2_SD
I2C3_HDMI: I2C3_SCL_HDMI, I2C3_SDA_HDMI
UART2DBG: UART2DBG_TX, UART2DBG_RX
UART0: UART0_RXD, UART0_TXD, UART0_CTS, UART0_RTS
I2C8: I2C8_SDA, I2C8_SCL
STM_I2C: STM_SDA, STM_SCL

### Nets
GND: P27.6 R59.2 ; port GND
VCC_3V0: P27.1 ; port VCC_3V0
VCCA_1V8: R58.2 U10.AC24(ADC_AVDD) ; port VCCA_1V8
CPU_B_SLEEP_H: U10.N31(GPIO1_C2/SPI3_CSN0) ; port CPU_B_SLEEP_H
GPU_SLEEP_H: U10.M25(GPIO1_B6/PWM3B_IR) ; port GPU_SLEEP_H
HW_ID: R58.1 R59.1 U10.AH27(ADC_IN4)
I2C0_SCL_PMIC: U10.N30(GPIO1_C0/SPI3_TXD/I2C0_SCL) ; port PMIC_I2C.I2C0_SCL_PMIC
I2C0_SDA_PMIC: U10.M26(GPIO1_B7/SPI3_RXD/I2C0_SDA) ; port PMIC_I2C.I2C0_SDA_PMIC
I2C3_SCL_HDMI: U10.AL2(GPIO4_C1/I2C3_SCL/UART2B_TX) ; port I2C3_HDMI.I2C3_SDA_HDMI  [project net I2C3_HDMI.I2C3_SDA_HDMI]
I2C3_SDA_HDMI: U10.AG6(GPIO4_C0/I2C3_SDA/UART2B_RX) ; port I2C3_HDMI.I2C3_SCL_HDMI  [project net I2C3_HDMI.I2C3_SCL_HDMI]
I2C8_SCL: SB7.1 ; port I2C8.I2C8_SCL  [project net I2C8.I2C8_SCL]
I2C8_SDA: U10.M29(GPIO1_C4/I2C8_SDA) ; port I2C8.I2C8_SDA  [project net I2C8.I2C8_SDA]
I2S2_CK: U10.AG3(GPIO3_D0/I2S0_SCLK) ; port DSP_I2S.I2S2_CK  [project net DSP_I2S.I2S2_CK]
I2S2_SD: SB12.1 SB13.1 ; port DSP_I2S.I2S2_SD  [project net DSP_I2S.I2S2_SD]
I2S2_WS: SB10.1 SB11.1 ; port DSP_I2S.I2S2_WS  [project net DSP_I2S.I2S2_WS]
LOG_DVS_PWM: U10.M28(GPIO1_C3/PWM2) ; port LOG_DVS_PWM
OTP_OUT_H: U10.P26(GPIO1_A6/TSADC_INT) ; port OTP_OUT_H
PMCU_TCK: P28.1 SB8.2 U10.P28(GPIO1_B1/SPI1_CLK/PMCU_JTAG_TCK)
PMCU_TMS: P28.2 SB9.2 U10.P29(GPIO1_B2/SPI1_CSN0/PMCU_JTAG_TMS)
PMIC_INT_L: SB6.1 ; port PMIC_INT_L
RECOVER: U10.AH26(ADC_IN1) ; port RECOVER
SPI1_CLK: P27.5 SB8.1
SPI1_CSN0: P27.4 SB9.1
SPI1_RXD/UART4_RXD: P27.2 U10.P27(GPIO1_A7/SPI1_RXD/UART4_RX)
SPI1_TXD/UART4_TXD: P27.3 U10.R31(GPIO1_B0/SPI1_TXD/UART4_TX)
STM_SCL: U10.Y6(GPIO4_A2/I2C1_SCL) ; port STM_I2C.STM_SDA  [project net STM_I2C.STM_SDA]
STM_SDA: U10.AG1(GPIO4_A1/I2C1_SDA) ; port STM_I2C.STM_SCL  [project net STM_I2C.STM_SCL]
UART0_CTS: U10.AG8(GPIO2_C2/UART0_CTSN) ; port UART0.UART0_CTS  [project net UART0.UART0_CTS]
UART0_RTS: U10.AL5(GPIO2_C3/UART0_RTSN) ; port UART0.UART0_RTS  [project net UART0.UART0_RTS]
UART0_RXD: U10.AE9(GPIO2_C0/UART0_RX) ; port UART0.UART0_RXD  [project net UART0.UART0_RXD]
UART0_TXD: U10.AH8(GPIO2_C1/UART0_TX) ; port UART0.UART0_TXD  [project net UART0.UART0_TXD]
UART2DBG_RX: U10.AK2(GPIO4_C3/UART2C_RX) ; port UART2DBG.UART2DBG_RX  [project net UART2DBG.UART2DBG_RX]
UART2DBG_TX: U10.AJ4(GPIO4_C4/UART2C_TX) ; port UART2DBG.UART2DBG_TX  [project net UART2DBG.UART2DBG_TX]
WORK_LED: SB5.1 ; port WORK_LED
NetSB5_2: SB5.2 U10.P25(GPIO0_A6/PWM3A_IR)
NetSB6_2: SB6.2 SB7.2 U10.M30(GPIO1_C5/I2C8_SCL)
NetSB10_2: SB10.2 U10.AF4(GPIO3_D1/I2S0_LRCK_RX)
NetSB11_2: SB11.2 U10.AJ2(GPIO3_D2/I2S0_LRCK_TX)
NetSB12_2: SB12.2 U10.Y7(GPIO3_D3/I2S0_SDI0)
NetSB13_2: SB13.2 U10.AH1(GPIO3_D7/I2S0_SDO0)

Not connected (* = marked no-connect by the designer): U10 AA6(GPIO3_D5/I2S0_SDI2SDO2) AA7(GPIO4_A4/I2S1_LRCK_RX) AC6(GPIO4_A7/I2S1_SDO0) AC7(GPIO4_A0/I2S_CLK) AD6(GPIO4_A6/I2S1_SDI0) AE5(GPIO3_D4/I2S0_SDI1SDO3) AF3(GPIO4_A3/I2S1_SCLK) AF5(GPIO4_C2/PWM0/VOP0_PWM/VOP1_PWM) AG25(ADC_IN2) AG26(ADC_IN0) AG28(ADC_IN3) AH2(GPIO3_D6/I2S0_SDI3SDO1) AJ1(GPIO4_A5/I2S1_LRCK_TX) AL3(GPIO4_C6/PWM1) M27(GPIO1_C1/SPI3_CLK) P30(GPIO1_B4/I2C4_SCL) P31(GPIO1_B3/I2C4_SDA)

### Notes on the sheet
- 1
- Huzaifa Ali
- (in symbol RK3399, part W) SAR-ADC
- (in symbol RK3399, part Y) UART
- (in symbol RK3399, part Z) I2C
- (in symbol RK3399, part 27) PWM
- (in symbol RK3399, part 30) SPI1
- (in symbol RK3399, part 31) SPI3/I2C0
- (in symbol RK3399, part 32) I2S

### Library data of the parts
P27 = 61300611121: CONN HEADER 6 POS 2.54; Manufacturer: Wurth Electronics; Current Rating: 3A; Voltage Rating: 250V; Number of Positions: 6; Gender: Male; Connector Type: Male Pin; Pitch: 0.1inch; Supplier 1: Newark; Manufacturer Part Number: 61300611121; RoHS: Yes; Category: Headers and Wire Housings; Stock 1: 4996; Pricing 1: 1=0.34000, 10=0.28900, 25=0.24000, 50=0.20100, 100=0.18200 (USD); Mount: Through Hole; Contact Plating: Gold; Contact Material: Copper Alloy,Copper; Housing Material: PBT; Color: Black; Min Operating Temperature: -40°C; Max Operating Temperature: 125°C; Number of Rows: 1; Contact Gender: Male; Packaging: Bulk; Termination: Through Hole; Number of Contacts: 6; Series: WR-PHD; Contact Type: Male Pin; Contact Mating Length: 0.236inch; REACH SVHC: Unknown; Lead Free: Lead Free; RoHS Compliant: Yes; ComponentLink1URL: http://www.mouser.com/ds/2/445/6130xx11121-538006.pdf?src-supplier=Mouser; ComponentLink1Description: http://www.mouser.com/ds/2/445/6130xx11121-538006.pdf?src-supplier=Mouser; ComponentLink2URL: http://www.farnell.com/cad/1737268.pdf?src-supplier=Element14; ComponentLink2Description: http://www.farnell.com/cad/1737268.pdf?src-supplier=Element14; ComponentLink3URL: https://katalog.we-online.de/em/datasheet/6130xx11121.pdf?src-supplier=Digi-Key; ComponentLink3Description: https://katalog.we-online.de/em/datasheet/6130xx11121.pdf?src-supplier=Digi-Key; Supplier Part Number 1: 20X0957
P28 = 61300211121: as P29 on sheet MISCIO_Sheet; Supplier 1: Digi-Key; Manufacturer Part Number: 61300211121; Stock 1: 219205; Pricing 1: 1=0.13, 10=0.106, 25=0.088, 50=0.074, 100=0.067, 1000=0.061 (USD); Mount: Through Hole; Contact Plating: Gold; Housing Material: PBT; Contact Material: Copper Alloy,Copper; Color: Black; Min Operating Temperature: -40°C; Max Operating Temperature: 125°C; Number of Rows: 1; Contact Gender: Male; Packaging: Bulk; Termination: Through Hole; Number of Contacts: 2; Contact Mating Length: 0.236inch; REACH SVHC: Unknown; Lead Free: Lead Free; ComponentLink1URL: http://www.mouser.com/ds/2/445/6130xx11121-538006.pdf?src-supplier=Mouser; ComponentLink1Description: http://www.mouser.com/ds/2/445/6130xx11121-538006.pdf?src-supplier=Mouser; Supplier Part Number 1: 732-5315-ND
R58 R59 = AC0603JR-0710KL: as R66 on sheet MISCIO_Sheet; Supplier 1: Future Electronics; Manufacturer Part Number: AC0603JR-0710KL; RoHS: Yes; Category: Chip SMD Resistors; Stock 1: 1533000; Pricing 1: 5000=0.00540 (USD); Case/Package: 0603; Case Code (Imperial): 0603; Case Code (Metric): 1608; Size Code: 0603; Min Operating Temperature: -55°C; Max Operating Temperature: 155°C; Packaging: Tape and Reel; Tolerance: 5%; Package Quantity: 1; Resistor Type: Thick Film; Termination: SMD/SMT; Number of Terminations: 2; Max Power Dissipation: 100mW; Features: Moisture Resistant,Automotive AEC-Q200,Anti-Sulfur; Series: AC; Construction: Rectangular; Length: 0.063inch; Width: 0.031inch; Height: 0.022inch; Depth: 0.8mm; Military Standard: Not; Lead Free: Lead Free; RoHS Compliant: Yes; ComponentLink1URL: https://datasheet.ciiva.com/5562/pyu-ac-51-rohs-l-2-5562553.pdf?src-supplier=Mouser; ComponentLink1Description: https://datasheet.ciiva.com/5562/pyu-ac-51-rohs-l-2-5562553.pdf?src-supplier=Mouser; Supplier Part Number 1: 1029044
SB5-SB13 = Solder Bridge: Solder Bridge ON
U10 = RK3399: as U10 on sheet USB_Sheet; ComponentLink1Description: Aliexpress; ComponentLink1URL: https://www.aliexpress.com/item/1005001971093459.html?spm=a2g0n.productlist.0.0.3c7csv8Qsv8Quh&browser_id=3ac7e9efb8074641aaabc4d871f09748&aff_trace_key=&aff_platform=msite&m_page_id=181389a08711fc2600d8cc522bab8d702dd4189be0&gclid=&pdp_npi=2%40dis%21USD%21%2123.6%21%21%21%21%21%402101d91e16545120399167831e8b89%21%21sea&algo_pvid=4303aedd-774c-4013-953d-920f10b55003; Manufacturer Part Number: RK3399; Footprint: FCBGA828